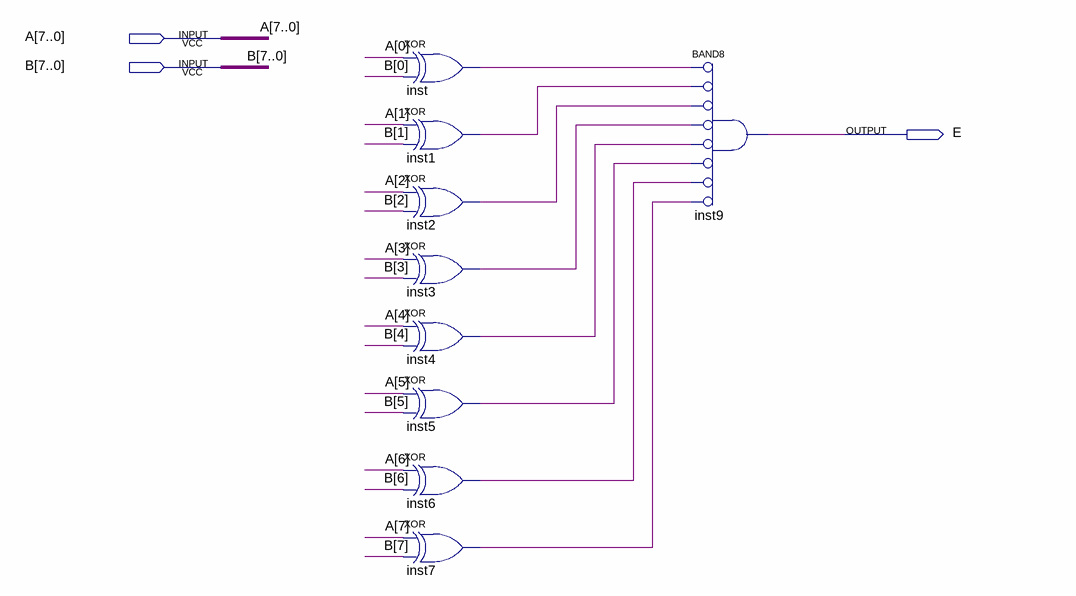
[diagram p0: schematic sheet]
// Quartus schematic 8bit-Eq.bdf as structural Verilog: 9 symbols, 3 pins
module \8bit-Eq  (
  input  [7:0] A,
  input  [7:0] B,
  output E
);

  wire inst1_out, inst2_out, inst3_out, inst4_out, inst5_out, inst6_out, inst7_out, inst_out;

  xor inst (inst_out, A[0], B[0]);
  xor inst1 (inst1_out, A[1], B[1]);
  xor inst2 (inst2_out, A[2], B[2]);
  xor inst3 (inst3_out, A[3], B[3]);
  xor inst4 (inst4_out, A[4], B[4]);
  xor inst5 (inst5_out, A[5], B[5]);
  xor inst6 (inst6_out, A[6], B[6]);
  xor inst7 (inst7_out, A[7], B[7]);
  and inst9 (E, ~inst_out, ~inst1_out, ~inst2_out, ~inst3_out, ~inst4_out, ~inst5_out, ~inst6_out, ~inst7_out);  // BAND8
endmodule
